# Altium schematic sheet 04_test3.SchDoc
size A3
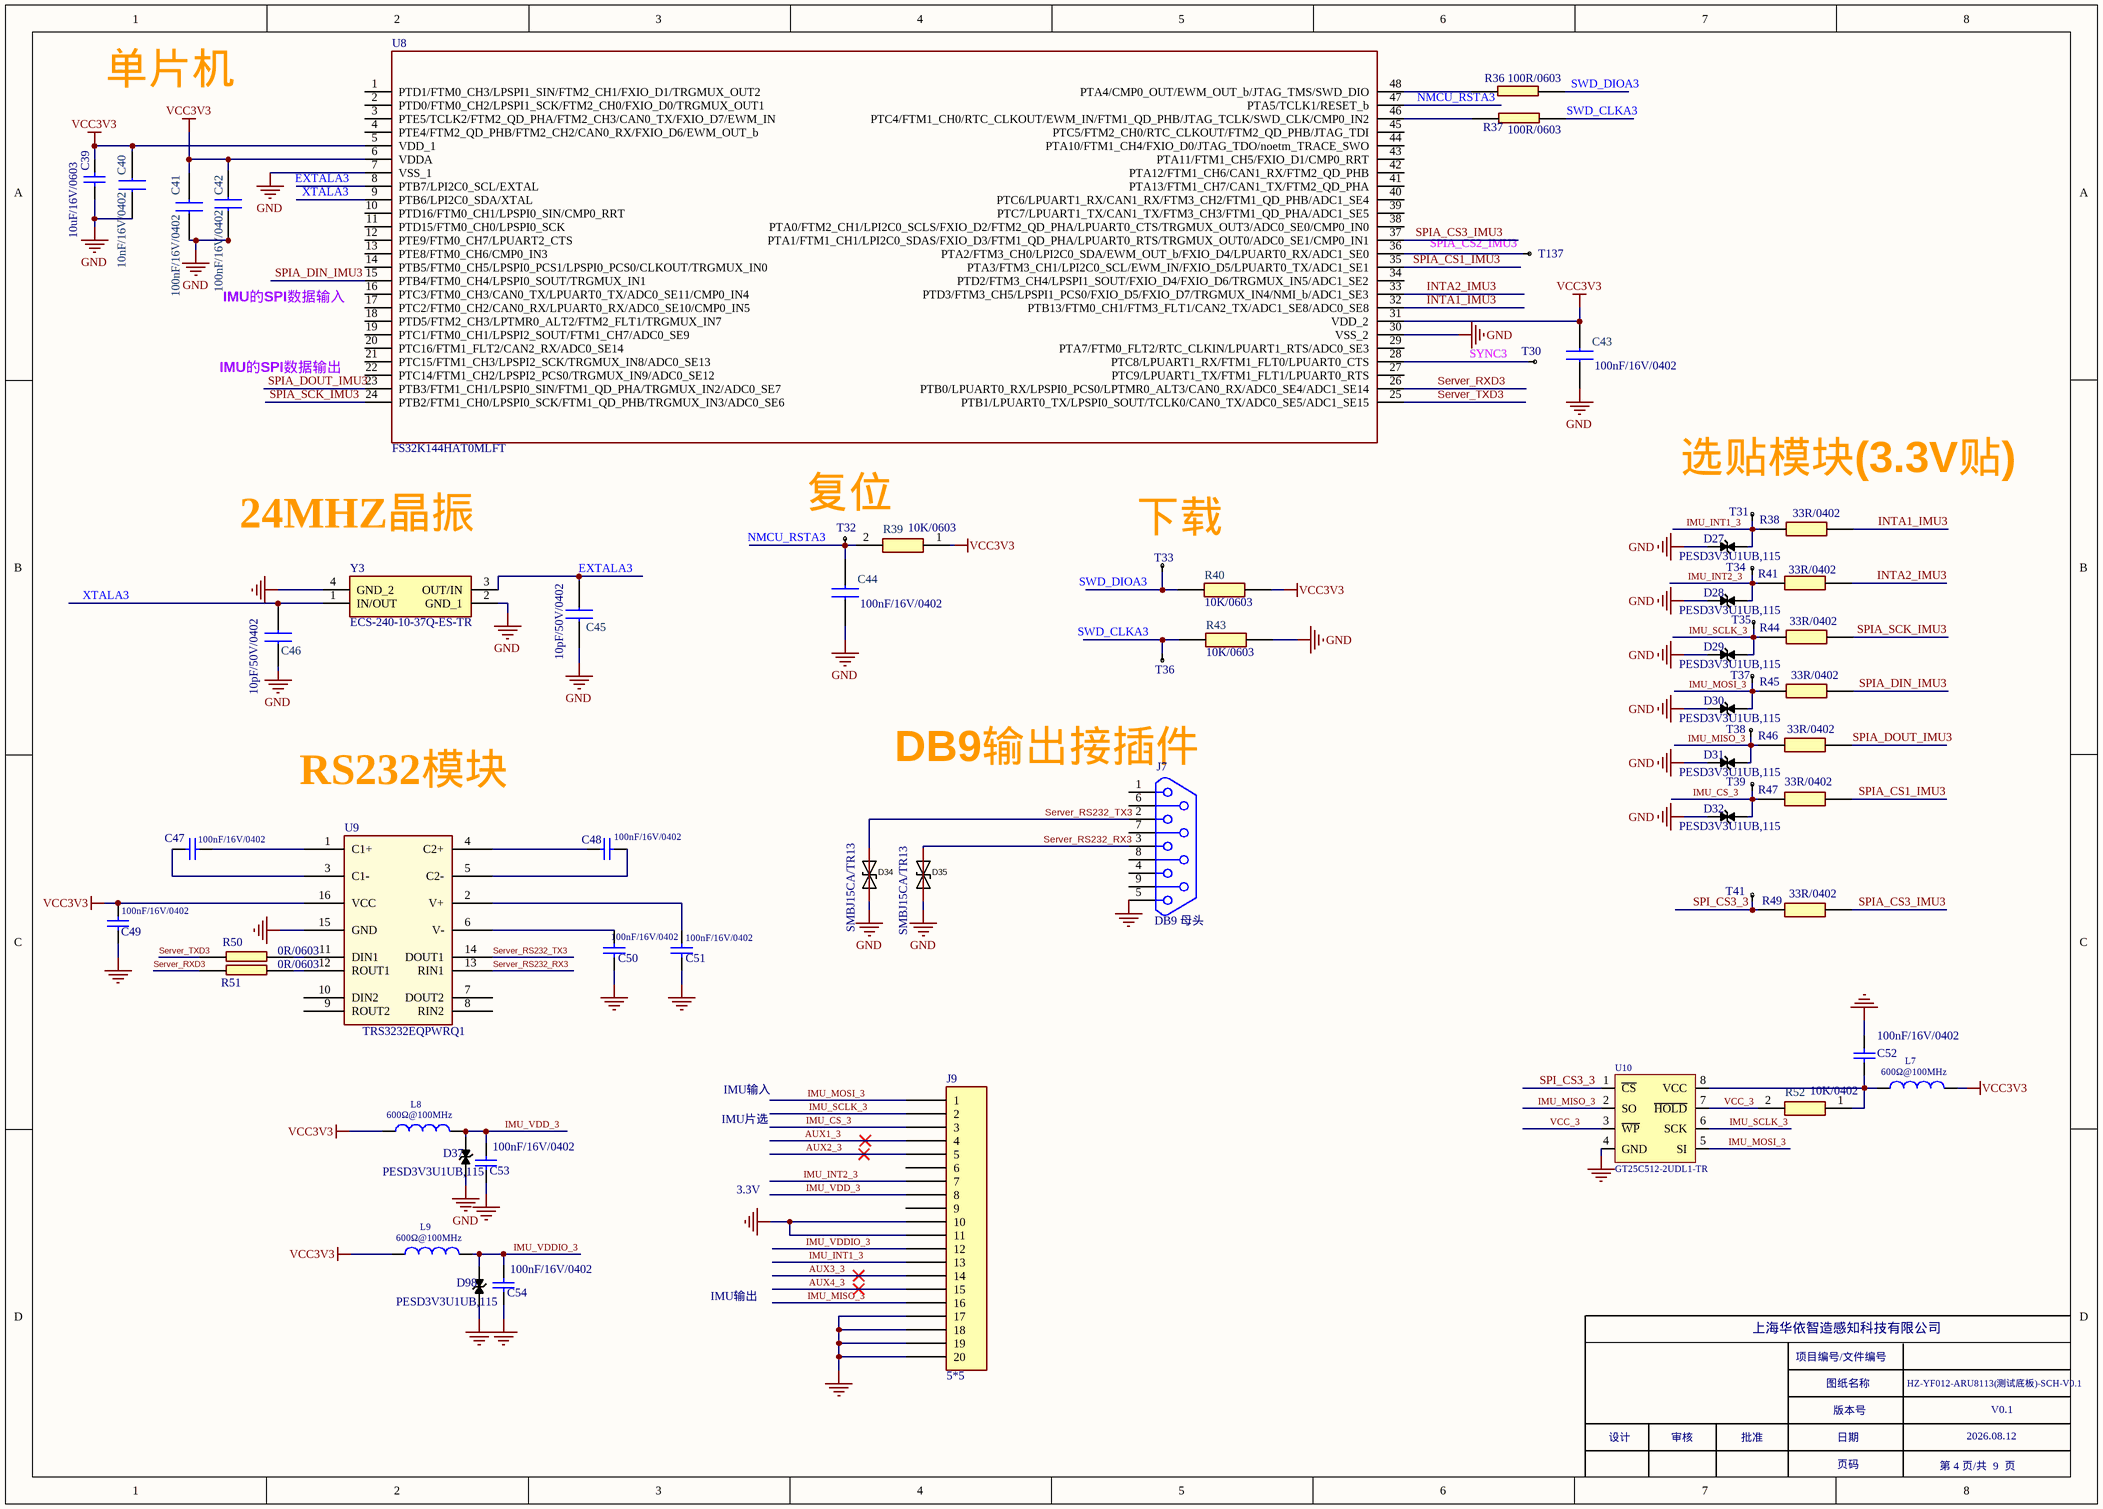
[diagram p0: 04_test3.SchDoc]

## Parts
C39  10uF/16V/0603  [C 0603_L]
C40  10nF/16V/0402  [C 0402_L]
C41  100nF/16V/0402  [C 0402_L]
C42  100nF/16V/0402  [C 0402_L]
C43  100nF/16V/0402  [C 0402_L]
C44  100nF/16V/0402  [C 0402_L]
C45  10pF/50V/0402  [C 0402_L]
C46  10pF/50V/0402  [C 0402_L]
C47  value 100nF/16V/0402  [C 0402_L]  (hidden comment: Cap)
C48  value 100nF/16V/0402  [C 0402_L]  (hidden comment: Cap)
C49  value 100nF/16V/0402  [C 0402_L]  (hidden comment: Cap)
C50  value 100nF/16V/0402  [C 0402_L]  (hidden comment: Cap)
C51  value 100nF/16V/0402  [C 0402_L]  (hidden comment: Cap)
C52  100nF/16V/0402  [0402C]
C53  100nF/16V/0402  [C 0402_L]
C54  100nF/16V/0402  [C 0402_L]
D27  PESD3V3U1UB,115  [SOD-523]
D28  PESD3V3U1UB,115  [SOD-523]
D29  PESD3V3U1UB,115  [SOD-523]
D30  PESD3V3U1UB,115  [SOD-523]
D31  PESD3V3U1UB,115  [SOD-523]
D32  PESD3V3U1UB,115  [SOD-523]
D34  SMBJ15CA/TR13  [SMB]
D35  SMBJ15CA/TR13  [SMB]
D37  PESD3V3U1UB,115  [PESD3V3U1UB,115]
D98  PESD3V3U1UB,115  [PESD3V3U1UB,115]
J7  DB9 母头  [DB9-RS8R1-2R77]
J9  5*5  [5*5-socket]
L7  value 600Ω@100MHz  [0603L]  (hidden comment: Inductor)
L8  value 600Ω@100MHz  [0603L]  (hidden comment: Inductor)
L9  value 600Ω@100MHz  [0603L]  (hidden comment: Inductor)
R36  100R/0603  [R 0603_L]
R37  100R/0603  [R 0603_L]
R38  33R/0402  [0402R]
R39  10K/0603  [R 0603_L]
R40  10K/0603  [R 0603_L]
R41  33R/0402  [0402R]
R43  10K/0603  [0603R]
R44  33R/0402  [0402R]
R45  33R/0402  [0402R]
R46  33R/0402  [0402R]
R47  33R/0402  [0402R]
R49  33R/0402  [0402R]
R50  0R/0603  [R 0603_L]
R51  0R/0603  [R 0603_L]
R52  10K/0402  [0402R]
T30  TEST  [Test-0.5mm]  (value not drawn)
T31  TEST  [TEST]  (value not drawn)
T32  TEST  [TEST]  (value not drawn)
T33  TEST  [TEST]  (value not drawn)
T34  TEST  [TEST]  (value not drawn)
T35  TEST  [TEST]  (value not drawn)
T36  TEST  [TEST]  (value not drawn)
T37  TEST  [TEST]  (value not drawn)
T38  TEST  [TEST]  (value not drawn)
T39  TEST  [TEST]  (value not drawn)
T41  TEST  [Test-0.5mm]  (value not drawn)
T137  TEST  [Test-0.5mm]  (value not drawn)
U8  FS32K144HAT0MLFT  [LQFP48_7X7]
U9  TRS3232EQPWRQ1  [TSSOP16_640X500]
U10  GT25C512-2UDL1-TR  [GT25C512-2UDLA2-TR]
Y3  ECS-240-10-37Q-ES-TR  [ECS2401037QESTR]

## Nets
GND: C39.2 C40.1 C41.2 C42.2 C43.2 C44.2 C45.1 C46.1 C49.2 C50.2 C51.2 C52.1 C53.2 C54.2 D27.1 D28.1 D29.1 D30.1 D31.1 D32.1 D34.1 D35.1 D37.1 D98.1 J7.5 J9.10 J9.11 J9.17 J9.18 J9.19 J9.20 R43.1 U8.7(VSS_1) U8.30(VSS_2) U9.15(GND) U10.4(GND) Y3.2(GND_1) Y3.4(GND_2)
VCC3V3: C39.1 C40.2 C41.1 C42.1 C43.1 C49.1 L7.2 L8.1 L9.1 R39.1 R40.1 U8.5(VDD_1) U8.6(VDDA) U8.31(VDD_2) U9.16(VCC)
AUX1_3: J9.4
AUX2_3: J9.5
AUX3_3: J9.14
AUX4_3: J9.15
EXTALA3: C45.2 U8.8(PTB7/LPI2C0_SCL/EXTAL) Y3.3(OUT/IN)
IMU_CS_3: D32.2 J9.3 R47.2 T39.1
IMU_INT1_3: D27.2 J9.13 R38.2 T31.1
IMU_INT2_3: D28.2 J9.7 R41.2 T34.1
IMU_MISO_3: D31.2 J9.16 R46.2 T38.1 U10.2(SO)
IMU_MOSI_3: D30.2 J9.1 R45.2 T37.1 U10.5(SI)
IMU_SCLK_3: D29.2 J9.2 R44.2 T35.1 U10.6(SCK)
IMU_VDD_3: C53.1 D37.2 J9.8 L8.2
IMU_VDDIO_3: C54.1 D98.2 J9.12 L9.2
INTA1_IMU3: R38.1 U8.32(PTB13/FTM0_CH1/FTM3_FLT1/CAN2_TX/ADC1_SE8/ADC0_SE8)
INTA2_IMU3: R41.1 U8.33(PTD3/FTM3_CH5/LPSPI1_PCS0/FXIO_D5/FXIO_D7/TRGMUX_IN4/NMI_b/ADC1_SE3)
NMCU_RSTA3: C44.1 R39.2 T32.1 U8.47(PTA5/TCLK1/RESET_b)
Server_RS232_RX3: D35.2 J7.3 U9.13(RIN1)
Server_RS232_TX3: D34.2 J7.2 U9.14(DOUT1)
Server_RXD3: R51.1 U8.26(PTB0/LPUART0_RX/LPSPI0_PCS0/LPTMR0_ALT3/CAN0_RX/ADC0_SE4/ADC1_SE14)
Server_TXD3: R50.1 U8.25(PTB1/LPUART0_TX/LPSPI0_SOUT/TCLK0/CAN0_TX/ADC0_SE5/ADC1_SE15)
SPI_CS3_3: R49.2 T41.1 U10.1(~{CS})
SPIA_CS1_IMU3: R47.1 U8.35(PTA3/FTM3_CH1/LPI2C0_SCL/EWM_IN/FXIO_D5/LPUART0_TX/ADC1_SE1)
SPIA_CS3_IMU3: R49.1 U8.37(PTA1/FTM1_CH1/LPI2C0_SDAS/FXIO_D3/FTM1_QD_PHA/LPUART0_RTS/TRGMUX_OUT0/ADC0_SE1/CMP0_IN1)
SPIA_DIN_IMU3: R45.1 U8.15(PTB4/FTM0_CH4/LPSPI0_SOUT/TRGMUX_IN1)
SPIA_DOUT_IMU3: R46.1 U8.23(PTB3/FTM1_CH1/LPSPI0_SIN/FTM1_QD_PHA/TRGMUX_IN2/ADC0_SE7)
SPIA_SCK_IMU3: R44.1 U8.24(PTB2/FTM1_CH0/LPSPI0_SCK/FTM1_QD_PHB/TRGMUX_IN3/ADC0_SE6)
SWD_CLKA3: R37.2 R43.2 T36.1
SWD_DIOA3: R36.2 R40.2 T33.1
SYNC3: T30.1 U8.28(PTC8/LPUART1_RX/FTM1_FLT0/LPUART0_CTS)
VCC_3: R52.2 U10.3(~{WP}) U10.7(~{HOLD})
XTALA3: C46.2 U8.9(PTB6/LPI2C0_SDA/XTAL) Y3.1(IN/OUT)
NetC47_1: C47.1 U9.3(C1-)
NetC47_2: C47.2 U9.1(C1+)
NetC48_1: C48.1 U9.4(C2+)
NetC48_2: C48.2 U9.5(C2-)
NetC50_1: C50.1 U9.6(V-)
NetC51_1: C51.1 U9.2(V+)
NetC52_2: C52.2 L7.1 R52.1 U10.8(VCC)
NetR36_1: R36.1 U8.48(PTA4/CMP0_OUT/EWM_OUT_b/JTAG_TMS/SWD_DIO)
NetR37_1: R37.1 U8.46(PTC4/FTM1_CH0/RTC_CLKOUT/EWM_IN/FTM1_QD_PHB/JTAG_TCLK/SWD_CLK/CMP0_IN2)
NetR50_2: R50.2 U9.11(DIN1)
NetR51_2: R51.2 U9.12(ROUT1)
NetT137_1: T137.1 U8.36(PTA2/FTM3_CH0/LPI2C0_SDA/EWM_OUT_b/FXIO_D4/LPUART0_RX/ADC1_SE0)

Not connected (* = marked no-connect by the designer): J7 1 4 6 7 8 9; J9 6 9; U8 1(PTD1/FTM0_CH3/LPSPI1_SIN/FTM2_CH1/FXIO_D1/TRGMUX_OUT2) 2(PTD0/FTM0_CH2/LPSPI1_SCK/FTM2_CH0/FXIO_D0/TRGMUX_OUT1) 3(PTE5/TCLK2/FTM2_QD_PHA/FTM2_CH3/CAN0_TX/FXIO_D7/EWM_IN) 4(PTE4/FTM2_QD_PHB/FTM2_CH2/CAN0_RX/FXIO_D6/EWM_OUT_b) 10(PTD16/FTM0_CH1/LPSPI0_SIN/CMP0_RRT) 11(PTD15/FTM0_CH0/LPSPI0_SCK) 12(PTE9/FTM0_CH7/LPUART2_CTS) 13(PTE8/FTM0_CH6/CMP0_IN3) 14(PTB5/FTM0_CH5/LPSPI0_PCS1/LPSPI0_PCS0/CLKOUT/TRGMUX_IN0) 16(PTC3/FTM0_CH3/CAN0_TX/LPUART0_TX/ADC0_SE11/CMP0_IN4) 17(PTC2/FTM0_CH2/CAN0_RX/LPUART0_RX/ADC0_SE10/CMP0_IN5) 18(PTD5/FTM2_CH3/LPTMR0_ALT2/FTM2_FLT1/TRGMUX_IN7) 19(PTC1/FTM0_CH1/LPSPI2_SOUT/FTM1_CH7/ADC0_SE9) 20(PTC16/FTM1_FLT2/CAN2_RX/ADC0_SE14) 21(PTC15/FTM1_CH3/LPSPI2_SCK/TRGMUX_IN8/ADC0_SE13) 22(PTC14/FTM1_CH2/LPSPI2_PCS0/TRGMUX_IN9/ADC0_SE12) 27(PTC9/LPUART1_TX/FTM1_FLT1/LPUART0_RTS) 29(PTA7/FTM0_FLT2/RTC_CLKIN/LPUART1_RTS/ADC0_SE3) 34(PTD2/FTM3_CH4/LPSPI1_SOUT/FXIO_D4/FXIO_D6/TRGMUX_IN5/ADC1_SE2) 38(PTA0/FTM2_CH1/LPI2C0_SCLS/FXIO_D2/FTM2_QD_PHA/LPUART0_CTS/TRGMUX_OUT3/ADC0_SE0/CMP0_IN0) 39(PTC7/LPUART1_TX/CAN1_TX/FTM3_CH3/FTM1_QD_PHA/ADC1_SE5) 40(PTC6/LPUART1_RX/CAN1_RX/FTM3_CH2/FTM1_QD_PHB/ADC1_SE4) 41(PTA13/FTM1_CH7/CAN1_TX/FTM2_QD_PHA) 42(PTA12/FTM1_CH6/CAN1_RX/FTM2_QD_PHB) 43(PTA11/FTM1_CH5/FXIO_D1/CMP0_RRT) 44(PTA10/FTM1_CH4/FXIO_D0/JTAG_TDO/noetm_TRACE_SWO) 45(PTC5/FTM2_CH0/RTC_CLKOUT/FTM2_QD_PHB/JTAG_TDI); U9 7(DOUT2) 8(RIN2) 9(ROUT2) 10(DIN2)

## Notes on the sheet
- 单片机
- IMU的SPI数据输入
- IMU的SPI数据输出
- (near T32) 复位
- 选贴模块(3.3V贴)
- (near Y3) 24MHZ晶振
- (near T33) 下载
- DB9输出接插件
- (near U9) RS232模块
- IMU片选
- IMU输入
- 3.3V
- IMU输出
- 上海华依智造感知科技有限公司
- 项目编号/文件编号
- 图纸名称
- HZ-YF012-ARU8113(测试底板)-SCH-V0.1
- 设计
- 审核
- 批准
- 版本号
- 日期
- 2026.08.12
- V0.1
- 页码
- 第 4 页/共  9  页
- Labels drawn without touching a wire or pin: SPIA_CS2_IMU3

## Library data of the parts
C39 = Cap: SMD/SMT 10UF 16V 20% 0603; Published: 8-Jun-2000; LatestRevisionDate: 17-Jul-2002; LatestRevisionNote: Re-released for DXP Platform.; PackageReference: RAD-0.3; Publisher: Altium Limited; PackageDescription: Radial Cap, Thru-Hole; 2 Leads; 0.3 in Pin Spacing; Value: 10uF/16V
C40-C46 = 0402Capacitor: Capacitor; Manufacturer_Name: Murata Electronics; Manufacturer_Part_Number: GCM155R71C104KA55D; Datasheet Link: https://componentsearchengine.com//GCM155R71C104KA55D.pdf; Height: 0.55mm; Mouser2 Part Number: 81-GCM155R71C104KA5D; Mouser2 Price/Stock: https://www.mouser.com/Search/Refine.aspx?Keyword=81-GCM155R71C104KA5D
C47-C54 = Cap: '100nF/16V/10%/ 0402/X7R / -55℃ ～ 125℃/AEC-Q200; Published: 8-Jun-2000; LatestRevisionDate: 17-Jul-2002; LatestRevisionNote: Re-released for DXP Platform.; PackageReference: RAD-0.3; Publisher: Altium Limited; PackageDescription: Radial Cap, Thru-Hole; 2 Leads; 0.3 in Pin Spacing
  C52-C54: Value: 100nF/16V/0402
D27-D32 D37 D98 = SMBJ36CA: 双向TVS管；600W表面贴装瞬态电压抑制器,工作电压36V，SMB_DO-214AA封装 DIODES
D34 D35 = SMBJ15CA/TR13_C78410: Manufacturer: Brightking(君耀电子); Symbol: SMBJ15CA-C78410; Add into BOM: yes; polarity: 双向; Reverse Stand-Off Voltage (Vrwm): 15V; Maximum Clamping Voltage: 24.4V; Peak Pulse Current (Ipp)@10/1000us: 24.6A; Peak Pulse Power Dissipation (Ppp)@10/1000us: 600W; Breakdown Voltage: 16.7V; Type: TVS; Device: SMBJ15CA/TR13_C78410; LCSC Part Name: 双向 15V截止 24.6A峰值脉冲; Supplier Part: C78410; Manufacturer Part: SMBJ15CA/TR13; Supplier Footprint: SMB(DO-214AA); JLCPCB Part Class: Extended Part; Datasheet: https://atta.szlcsc.com/upload/public/pdf/source/20181127/C309995_EB3DFB9F9AEE5D2146ECD9FA5992A402.pdf; Supplier: LCSC; Convert to PCB: yes
J7 = DB9
L7-L9 = Inductor: Code_IEC: 1005; Published: 8-Jun-2000; LatestRevisionDate: 29-May-2009; LatestRevisionNote: IPC-7351 Footprint Added.; PackageReference: 0402-A; Publisher: Altium Limited; PackageDescription: Chip Inductor; Code_JEITA: 0402
R36 R37 R50 R51 = 0402
R38-R41 R43-R47 R49 R52 = 0402Resistor: Resistor; Manufacturer_Name: KOA Speer; Manufacturer_Part_Number: RN73H1ETTP1002F50; Datasheet Link: https://www.mouser.fr/datasheet/2/219/RN73H-12200.pdf; Height: 0.4mm
U8 = FS32K144HAT0MLFT: Integrated Circuit; Manufacturer_Name: NXP; Datasheet Link: http://www.nxp.com/docs/en/data-sheet/S32K-DS.pdf; Height: 1.6mm; Manufacturer_Part_Number: FS32K144HAT0MLFT
U10 = GT25C512-2UDLA2-TR
Y3 = ECS-240-10-37Q-ES-TR: Crystal or Oscillator; Manufacturer_Name: ECS; Datasheet Link: https://www.ecsxtal.com/store/pdf/ECX-1637Q.pdf; Height: 0.55mm; Manufacturer_Part_Number: ECS-240-10-37Q-ES-TR